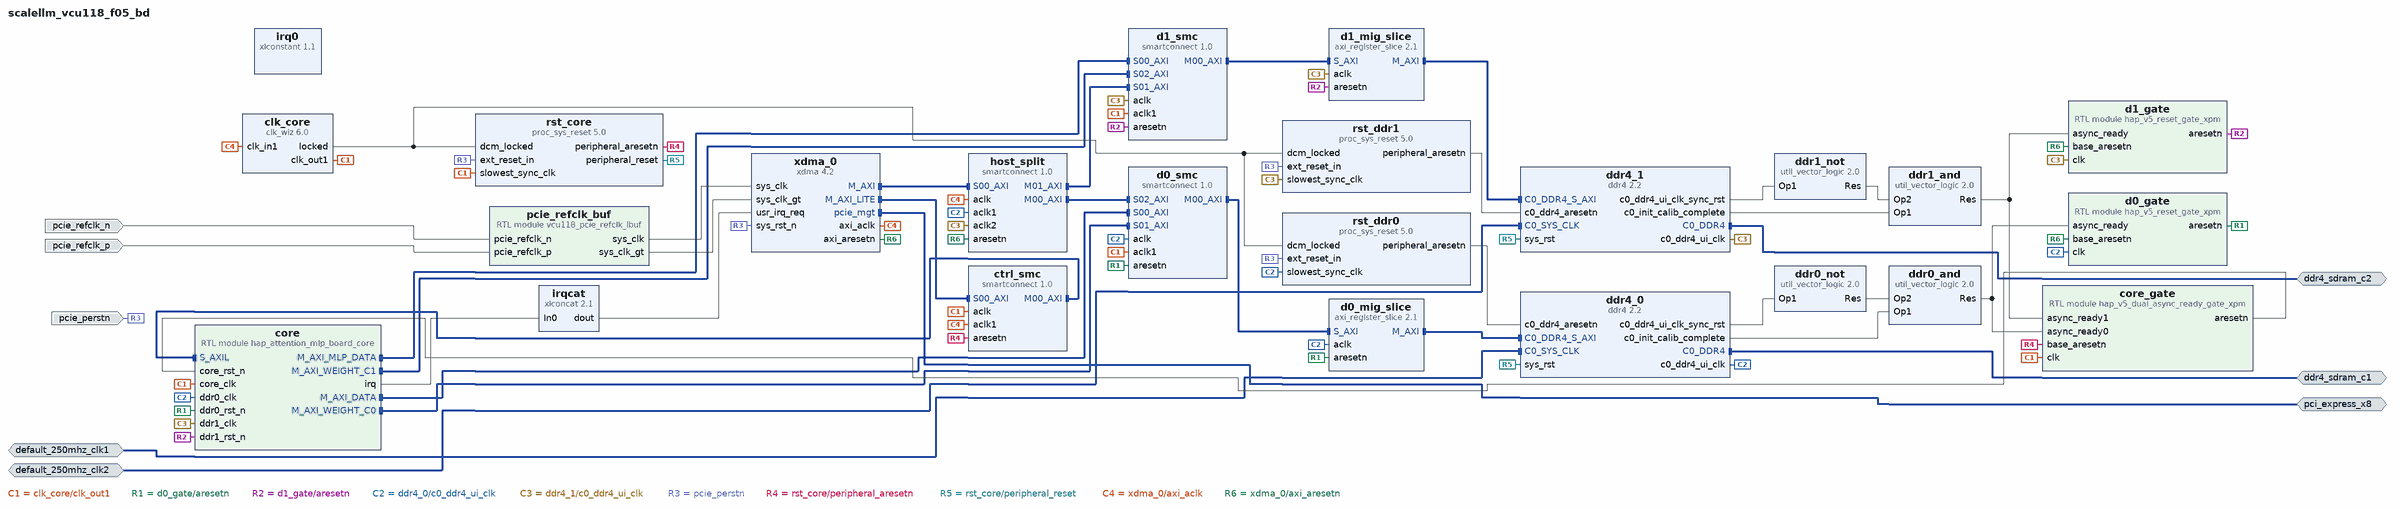
[diagram p0: block diagram of the top level]
# Vivado block design scalellm_vcu118_f05_bd, xcvu9p-flga2104-2L-e, Vivado 2025.2
create_bd_design scalellm_vcu118_f05_bd

create_bd_intf_port -mode Master -vlnv xilinx.com:interface:ddr4_rtl:1.0 ddr4_sdram_c1
create_bd_intf_port -mode Slave -vlnv xilinx.com:interface:diff_clock_rtl:1.0 default_250mhz_clk1
set_property -dict {CONFIG.FREQ_HZ 250000000} [get_bd_intf_ports default_250mhz_clk1]
create_bd_intf_port -mode Master -vlnv xilinx.com:interface:ddr4_rtl:1.0 ddr4_sdram_c2
create_bd_intf_port -mode Slave -vlnv xilinx.com:interface:diff_clock_rtl:1.0 default_250mhz_clk2
set_property -dict {CONFIG.FREQ_HZ 250000000} [get_bd_intf_ports default_250mhz_clk2]
create_bd_intf_port -mode Master -vlnv xilinx.com:interface:pcie_7x_mgt_rtl:1.0 pci_express_x8
create_bd_port -dir I -type rst pcie_perstn
set_property -dict {CONFIG.POLARITY ACTIVE_LOW} [get_bd_ports pcie_perstn]
create_bd_port -dir I -type clk pcie_refclk_p
create_bd_port -dir I -type clk pcie_refclk_n

create_bd_cell -type ip -vlnv xilinx.com:ip:xdma:4.2 xdma_0
set_property -dict [list \
  CONFIG.PCIE_BOARD_INTERFACE pci_express_x8 \
  CONFIG.SYS_RST_N_BOARD_INTERFACE pcie_perstn \
  CONFIG.axi_data_width 256_bit \
  CONFIG.axilite_master_en true \
  CONFIG.axisten_if_enable_msg_route true \
  CONFIG.mode_selection Advanced \
  CONFIG.pciebar2axibar_0 0x00000000 \
  CONFIG.pf0_bar0_64bit true \
  CONFIG.pf0_bar0_enabled true \
  CONFIG.pf0_bar0_scale Megabytes \
  CONFIG.pf0_bar0_size 1 \
  CONFIG.pf0_bar2_64bit true \
  CONFIG.pf0_bar2_enabled true \
  CONFIG.pf0_bar2_scale Gigabytes \
  CONFIG.pf0_bar2_size 4 \
  CONFIG.pf0_device_id 9018 \
  CONFIG.pf0_msi_enabled true \
  CONFIG.pf0_msix_enabled false \
  CONFIG.pl_link_cap_max_link_speed 8.0_GT/s \
  CONFIG.xdma_rnum_chnl 1 \
  CONFIG.xdma_wnum_chnl 1 \
] [get_bd_cells xdma_0]
create_bd_cell -type module -reference vcu118_pcie_refclk_ibuf pcie_refclk_buf
create_bd_cell -type ip -vlnv xilinx.com:ip:clk_wiz:6.0 clk_core
set_property -dict [list \
  CONFIG.CLKIN1_JITTER_PS 40.0 \
  CONFIG.CLKOUT1_REQUESTED_OUT_FREQ 100.0 \
  CONFIG.PRIMITIVE MMCM \
  CONFIG.PRIM_SOURCE No_buffer \
  CONFIG.USE_LOCKED true \
  CONFIG.USE_RESET false \
] [get_bd_cells clk_core]
create_bd_cell -type ip -vlnv xilinx.com:ip:proc_sys_reset:5.0 rst_core
set_property -dict {CONFIG.RESET_BOARD_INTERFACE Custom} [get_bd_cells rst_core]
create_bd_cell -type ip -vlnv xilinx.com:ip:ddr4:2.2 ddr4_0
set_property -dict [list \
  CONFIG.C0.DDR4_AxiAddressWidth 31 \
  CONFIG.C0.DDR4_AxiDataWidth 512 \
  CONFIG.C0.DDR4_AxiIDWidth 4 \
  CONFIG.C0.DDR4_Capacity 512 \
  CONFIG.C0.DDR4_ChipSelect true \
  CONFIG.C0.DDR4_Clamshell false \
  CONFIG.C0.DDR4_DataMask DM_NO_DBI \
  CONFIG.C0.DDR4_DataWidth 64 \
  CONFIG.C0.DDR4_InputClockPeriod 4000 \
  CONFIG.C0.DDR4_MCS_ECC false \
  CONFIG.C0.DDR4_Mem_Add_Map ROW_COLUMN_BANK \
  CONFIG.C0.DDR4_MemoryPart MT40A256M16GE-083E \
  CONFIG.C0.DDR4_MemoryType Components \
  CONFIG.C0.DDR4_MemoryVoltage 1.2V \
  CONFIG.C0.DDR4_PhyClockRatio 4:1 \
  CONFIG.C0.DDR4_Slot Single \
  CONFIG.C0.DDR4_TimePeriod 1250 \
  CONFIG.C0_CLOCK_BOARD_INTERFACE Custom \
  CONFIG.C0_DDR4_BOARD_INTERFACE Custom \
  CONFIG.System_Clock Differential \
] [get_bd_cells ddr4_0]
create_bd_cell -type ip -vlnv xilinx.com:ip:ddr4:2.2 ddr4_1
set_property -dict [list \
  CONFIG.C0.DDR4_AxiAddressWidth 31 \
  CONFIG.C0.DDR4_AxiDataWidth 512 \
  CONFIG.C0.DDR4_AxiIDWidth 4 \
  CONFIG.C0.DDR4_Capacity 512 \
  CONFIG.C0.DDR4_ChipSelect true \
  CONFIG.C0.DDR4_Clamshell false \
  CONFIG.C0.DDR4_DataMask DM_NO_DBI \
  CONFIG.C0.DDR4_DataWidth 64 \
  CONFIG.C0.DDR4_InputClockPeriod 4000 \
  CONFIG.C0.DDR4_MCS_ECC false \
  CONFIG.C0.DDR4_Mem_Add_Map ROW_COLUMN_BANK \
  CONFIG.C0.DDR4_MemoryPart MT40A256M16GE-083E \
  CONFIG.C0.DDR4_MemoryType Components \
  CONFIG.C0.DDR4_MemoryVoltage 1.2V \
  CONFIG.C0.DDR4_PhyClockRatio 4:1 \
  CONFIG.C0.DDR4_Slot Single \
  CONFIG.C0.DDR4_TimePeriod 1250 \
  CONFIG.C0_CLOCK_BOARD_INTERFACE Custom \
  CONFIG.C0_DDR4_BOARD_INTERFACE Custom \
  CONFIG.System_Clock Differential \
] [get_bd_cells ddr4_1]
create_bd_cell -type ip -vlnv xilinx.com:ip:util_vector_logic:2.0 ddr0_not
set_property -dict {CONFIG.C_OPERATION not CONFIG.C_SIZE 1} [get_bd_cells ddr0_not]
create_bd_cell -type ip -vlnv xilinx.com:ip:util_vector_logic:2.0 ddr0_and
set_property -dict {CONFIG.C_OPERATION and CONFIG.C_SIZE 1} [get_bd_cells ddr0_and]
create_bd_cell -type ip -vlnv xilinx.com:ip:util_vector_logic:2.0 ddr1_not
set_property -dict {CONFIG.C_OPERATION not CONFIG.C_SIZE 1} [get_bd_cells ddr1_not]
create_bd_cell -type ip -vlnv xilinx.com:ip:util_vector_logic:2.0 ddr1_and
set_property -dict {CONFIG.C_OPERATION and CONFIG.C_SIZE 1} [get_bd_cells ddr1_and]
create_bd_cell -type module -reference hap_attention_mlp_board_core core
create_bd_cell -type module -reference hap_v5_dual_async_ready_gate_xpm core_gate
create_bd_cell -type module -reference hap_v5_reset_gate_xpm d0_gate
create_bd_cell -type ip -vlnv xilinx.com:ip:proc_sys_reset:5.0 rst_ddr0
set_property -dict {CONFIG.RESET_BOARD_INTERFACE Custom} [get_bd_cells rst_ddr0]
create_bd_cell -type module -reference hap_v5_reset_gate_xpm d1_gate
create_bd_cell -type ip -vlnv xilinx.com:ip:proc_sys_reset:5.0 rst_ddr1
set_property -dict {CONFIG.RESET_BOARD_INTERFACE Custom} [get_bd_cells rst_ddr1]
create_bd_cell -type ip -vlnv xilinx.com:ip:smartconnect:1.0 ctrl_smc
set_property -dict {CONFIG.NUM_CLKS 2 CONFIG.NUM_MI 1 CONFIG.NUM_SI 1} [get_bd_cells ctrl_smc]
create_bd_cell -type ip -vlnv xilinx.com:ip:smartconnect:1.0 host_split
set_property -dict {CONFIG.NUM_CLKS 3 CONFIG.NUM_MI 2 CONFIG.NUM_SI 1} [get_bd_cells host_split]
create_bd_cell -type ip -vlnv xilinx.com:ip:smartconnect:1.0 d0_smc
set_property -dict {CONFIG.NUM_CLKS 2 CONFIG.NUM_MI 1 CONFIG.NUM_SI 3} [get_bd_cells d0_smc]
create_bd_cell -type ip -vlnv xilinx.com:ip:smartconnect:1.0 d1_smc
set_property -dict {CONFIG.NUM_CLKS 2 CONFIG.NUM_MI 1 CONFIG.NUM_SI 3} [get_bd_cells d1_smc]
create_bd_cell -type ip -vlnv xilinx.com:ip:axi_register_slice:2.1 d0_mig_slice
set_property -dict [list \
  CONFIG.NUM_SLR_CROSSINGS 2 \
  CONFIG.PIPELINES_MASTER_AR 1 \
  CONFIG.PIPELINES_MASTER_AW 1 \
  CONFIG.PIPELINES_MASTER_B 1 \
  CONFIG.PIPELINES_MASTER_R 1 \
  CONFIG.PIPELINES_MASTER_W 1 \
  CONFIG.PIPELINES_MIDDLE_AR 1 \
  CONFIG.PIPELINES_MIDDLE_AW 1 \
  CONFIG.PIPELINES_MIDDLE_B 1 \
  CONFIG.PIPELINES_MIDDLE_R 1 \
  CONFIG.PIPELINES_MIDDLE_W 1 \
  CONFIG.PIPELINES_SLAVE_AR 1 \
  CONFIG.PIPELINES_SLAVE_AW 1 \
  CONFIG.PIPELINES_SLAVE_B 1 \
  CONFIG.PIPELINES_SLAVE_R 1 \
  CONFIG.PIPELINES_SLAVE_W 1 \
  CONFIG.REG_AR 15 \
  CONFIG.REG_AW 15 \
  CONFIG.REG_B 15 \
  CONFIG.REG_R 15 \
  CONFIG.REG_W 15 \
  CONFIG.USE_AUTOPIPELINING 0 \
] [get_bd_cells d0_mig_slice]
create_bd_cell -type ip -vlnv xilinx.com:ip:axi_register_slice:2.1 d1_mig_slice
set_property -dict [list \
  CONFIG.NUM_SLR_CROSSINGS 2 \
  CONFIG.PIPELINES_MASTER_AR 1 \
  CONFIG.PIPELINES_MASTER_AW 1 \
  CONFIG.PIPELINES_MASTER_B 1 \
  CONFIG.PIPELINES_MASTER_R 1 \
  CONFIG.PIPELINES_MASTER_W 1 \
  CONFIG.PIPELINES_MIDDLE_AR 1 \
  CONFIG.PIPELINES_MIDDLE_AW 1 \
  CONFIG.PIPELINES_MIDDLE_B 1 \
  CONFIG.PIPELINES_MIDDLE_R 1 \
  CONFIG.PIPELINES_MIDDLE_W 1 \
  CONFIG.PIPELINES_SLAVE_AR 1 \
  CONFIG.PIPELINES_SLAVE_AW 1 \
  CONFIG.PIPELINES_SLAVE_B 1 \
  CONFIG.PIPELINES_SLAVE_R 1 \
  CONFIG.PIPELINES_SLAVE_W 1 \
  CONFIG.REG_AR 15 \
  CONFIG.REG_AW 15 \
  CONFIG.REG_B 15 \
  CONFIG.REG_R 15 \
  CONFIG.REG_W 15 \
  CONFIG.USE_AUTOPIPELINING 0 \
] [get_bd_cells d1_mig_slice]
create_bd_cell -type ip -vlnv xilinx.com:ip:xlconcat:2.1 irqcat
set_property -dict {CONFIG.NUM_PORTS 1} [get_bd_cells irqcat]
create_bd_cell -type ip -vlnv xilinx.com:ip:xlconstant:1.1 irq0

# ---- connections ----

connect_bd_intf_net [get_bd_intf_pins core/M_AXI_DATA] [get_bd_intf_pins d0_smc/S00_AXI]
connect_bd_intf_net [get_bd_intf_pins core/M_AXI_MLP_DATA] [get_bd_intf_pins d1_smc/S00_AXI]
connect_bd_intf_net [get_bd_intf_pins core/M_AXI_WEIGHT_C0] [get_bd_intf_pins d0_smc/S01_AXI]
connect_bd_intf_net [get_bd_intf_pins core/M_AXI_WEIGHT_C1] [get_bd_intf_pins d1_smc/S02_AXI]
connect_bd_intf_net [get_bd_intf_pins ctrl_smc/M00_AXI] [get_bd_intf_pins core/S_AXIL]
connect_bd_intf_net [get_bd_intf_pins d0_mig_slice/M_AXI] [get_bd_intf_pins ddr4_0/C0_DDR4_S_AXI]
connect_bd_intf_net [get_bd_intf_pins d0_smc/M00_AXI] [get_bd_intf_pins d0_mig_slice/S_AXI]
connect_bd_intf_net [get_bd_intf_pins d1_mig_slice/M_AXI] [get_bd_intf_pins ddr4_1/C0_DDR4_S_AXI]
connect_bd_intf_net [get_bd_intf_pins d1_smc/M00_AXI] [get_bd_intf_pins d1_mig_slice/S_AXI]
connect_bd_intf_net [get_bd_intf_ports ddr4_sdram_c1] [get_bd_intf_pins ddr4_0/C0_DDR4]
connect_bd_intf_net [get_bd_intf_ports ddr4_sdram_c2] [get_bd_intf_pins ddr4_1/C0_DDR4]
connect_bd_intf_net -intf_net default_250mhz_clk1_1 [get_bd_intf_ports default_250mhz_clk1] [get_bd_intf_pins ddr4_0/C0_SYS_CLK]
connect_bd_intf_net -intf_net default_250mhz_clk2_1 [get_bd_intf_ports default_250mhz_clk2] [get_bd_intf_pins ddr4_1/C0_SYS_CLK]
connect_bd_intf_net [get_bd_intf_pins host_split/M00_AXI] [get_bd_intf_pins d0_smc/S02_AXI]
connect_bd_intf_net [get_bd_intf_pins host_split/M01_AXI] [get_bd_intf_pins d1_smc/S01_AXI]
connect_bd_intf_net [get_bd_intf_pins xdma_0/M_AXI] [get_bd_intf_pins host_split/S00_AXI]
connect_bd_intf_net [get_bd_intf_pins xdma_0/M_AXI_LITE] [get_bd_intf_pins ctrl_smc/S00_AXI]
connect_bd_intf_net [get_bd_intf_ports pci_express_x8] [get_bd_intf_pins xdma_0/pcie_mgt]
connect_bd_net [get_bd_pins clk_core/clk_out1] \
  [get_bd_pins rst_core/slowest_sync_clk] [get_bd_pins core/core_clk] [get_bd_pins core_gate/clk] [get_bd_pins ctrl_smc/aclk] \
  [get_bd_pins d0_smc/aclk1] [get_bd_pins d1_smc/aclk1]
connect_bd_net [get_bd_pins clk_core/locked] [get_bd_pins rst_core/dcm_locked] [get_bd_pins rst_ddr0/dcm_locked] [get_bd_pins rst_ddr1/dcm_locked]
connect_bd_net [get_bd_pins core_gate/aresetn] [get_bd_pins core/core_rst_n]
connect_bd_net [get_bd_pins core/irq] [get_bd_pins irqcat/In0]
connect_bd_net [get_bd_pins d0_gate/aresetn] [get_bd_pins core/ddr0_rst_n] [get_bd_pins d0_smc/aresetn] [get_bd_pins d0_mig_slice/aresetn]
connect_bd_net [get_bd_pins d1_gate/aresetn] [get_bd_pins core/ddr1_rst_n] [get_bd_pins d1_smc/aresetn] [get_bd_pins d1_mig_slice/aresetn]
connect_bd_net [get_bd_pins ddr0_and/Res] [get_bd_pins core_gate/async_ready0] [get_bd_pins d0_gate/async_ready]
connect_bd_net [get_bd_pins ddr0_not/Res] [get_bd_pins ddr0_and/Op2]
connect_bd_net [get_bd_pins ddr1_and/Res] [get_bd_pins core_gate/async_ready1] [get_bd_pins d1_gate/async_ready]
connect_bd_net [get_bd_pins ddr1_not/Res] [get_bd_pins ddr1_and/Op2]
connect_bd_net [get_bd_pins ddr4_0/c0_ddr4_ui_clk] \
  [get_bd_pins core/ddr0_clk] [get_bd_pins d0_gate/clk] [get_bd_pins rst_ddr0/slowest_sync_clk] \
  [get_bd_pins host_split/aclk1] [get_bd_pins d0_smc/aclk] [get_bd_pins d0_mig_slice/aclk]
connect_bd_net [get_bd_pins ddr4_0/c0_ddr4_ui_clk_sync_rst] [get_bd_pins ddr0_not/Op1]
connect_bd_net [get_bd_pins ddr4_0/c0_init_calib_complete] [get_bd_pins ddr0_and/Op1]
connect_bd_net [get_bd_pins ddr4_1/c0_ddr4_ui_clk] \
  [get_bd_pins core/ddr1_clk] [get_bd_pins d1_gate/clk] [get_bd_pins rst_ddr1/slowest_sync_clk] \
  [get_bd_pins host_split/aclk2] [get_bd_pins d1_smc/aclk] [get_bd_pins d1_mig_slice/aclk]
connect_bd_net [get_bd_pins ddr4_1/c0_ddr4_ui_clk_sync_rst] [get_bd_pins ddr1_not/Op1]
connect_bd_net [get_bd_pins ddr4_1/c0_init_calib_complete] [get_bd_pins ddr1_and/Op1]
connect_bd_net [get_bd_pins irqcat/dout] [get_bd_pins xdma_0/usr_irq_req]
connect_bd_net [get_bd_ports pcie_perstn] \
  [get_bd_pins xdma_0/sys_rst_n] [get_bd_pins rst_core/ext_reset_in] [get_bd_pins rst_ddr0/ext_reset_in] \
  [get_bd_pins rst_ddr1/ext_reset_in]
connect_bd_net [get_bd_pins pcie_refclk_buf/sys_clk] [get_bd_pins xdma_0/sys_clk]
connect_bd_net [get_bd_pins pcie_refclk_buf/sys_clk_gt] [get_bd_pins xdma_0/sys_clk_gt]
connect_bd_net -net pcie_refclk_n_0_1 [get_bd_ports pcie_refclk_n] [get_bd_pins pcie_refclk_buf/pcie_refclk_n]
connect_bd_net -net pcie_refclk_p_0_1 [get_bd_ports pcie_refclk_p] [get_bd_pins pcie_refclk_buf/pcie_refclk_p]
connect_bd_net [get_bd_pins rst_core/peripheral_aresetn] [get_bd_pins core_gate/base_aresetn] [get_bd_pins ctrl_smc/aresetn]
connect_bd_net [get_bd_pins rst_core/peripheral_reset] [get_bd_pins ddr4_0/sys_rst] [get_bd_pins ddr4_1/sys_rst]
connect_bd_net [get_bd_pins rst_ddr0/peripheral_aresetn] [get_bd_pins ddr4_0/c0_ddr4_aresetn]
connect_bd_net [get_bd_pins rst_ddr1/peripheral_aresetn] [get_bd_pins ddr4_1/c0_ddr4_aresetn]
connect_bd_net [get_bd_pins xdma_0/axi_aclk] [get_bd_pins clk_core/clk_in1] [get_bd_pins ctrl_smc/aclk1] [get_bd_pins host_split/aclk]
connect_bd_net [get_bd_pins xdma_0/axi_aresetn] [get_bd_pins d0_gate/base_aresetn] [get_bd_pins d1_gate/base_aresetn] [get_bd_pins host_split/aresetn]

# ---- address map ----
assign_bd_address -offset 0x00000000 -range 2G -target_address_space [get_bd_addr_spaces core/M_AXI_DATA] [get_bd_addr_segs ddr4_0/C0_DDR4_MEMORY_MAP/C0_DDR4_ADDRESS_BLOCK]
assign_bd_address -offset 0x00000000 -range 2G -target_address_space [get_bd_addr_spaces core/M_AXI_MLP_DATA] [get_bd_addr_segs ddr4_1/C0_DDR4_MEMORY_MAP/C0_DDR4_ADDRESS_BLOCK]
assign_bd_address -offset 0x00000000 -range 2G -target_address_space [get_bd_addr_spaces core/M_AXI_WEIGHT_C0] [get_bd_addr_segs ddr4_0/C0_DDR4_MEMORY_MAP/C0_DDR4_ADDRESS_BLOCK]
assign_bd_address -offset 0x00000000 -range 2G -target_address_space [get_bd_addr_spaces core/M_AXI_WEIGHT_C1] [get_bd_addr_segs ddr4_1/C0_DDR4_MEMORY_MAP/C0_DDR4_ADDRESS_BLOCK]
assign_bd_address -offset 0x0000000000000000 -range 2G -target_address_space [get_bd_addr_spaces xdma_0/M_AXI] [get_bd_addr_segs ddr4_0/C0_DDR4_MEMORY_MAP/C0_DDR4_ADDRESS_BLOCK]
assign_bd_address -offset 0x0000000080000000 -range 2G -target_address_space [get_bd_addr_spaces xdma_0/M_AXI] [get_bd_addr_segs ddr4_1/C0_DDR4_MEMORY_MAP/C0_DDR4_ADDRESS_BLOCK]
assign_bd_address -offset 0x00000000 -range 4K -target_address_space [get_bd_addr_spaces xdma_0/M_AXI_LITE] [get_bd_addr_segs core/S_AXIL/reg0]

validate_bd_design
save_bd_design
